# Altium schematic sheet Power_Section.SchDoc
size A4; DocumentNumber: 2; SheetNumber: 2; SheetTotal: 27
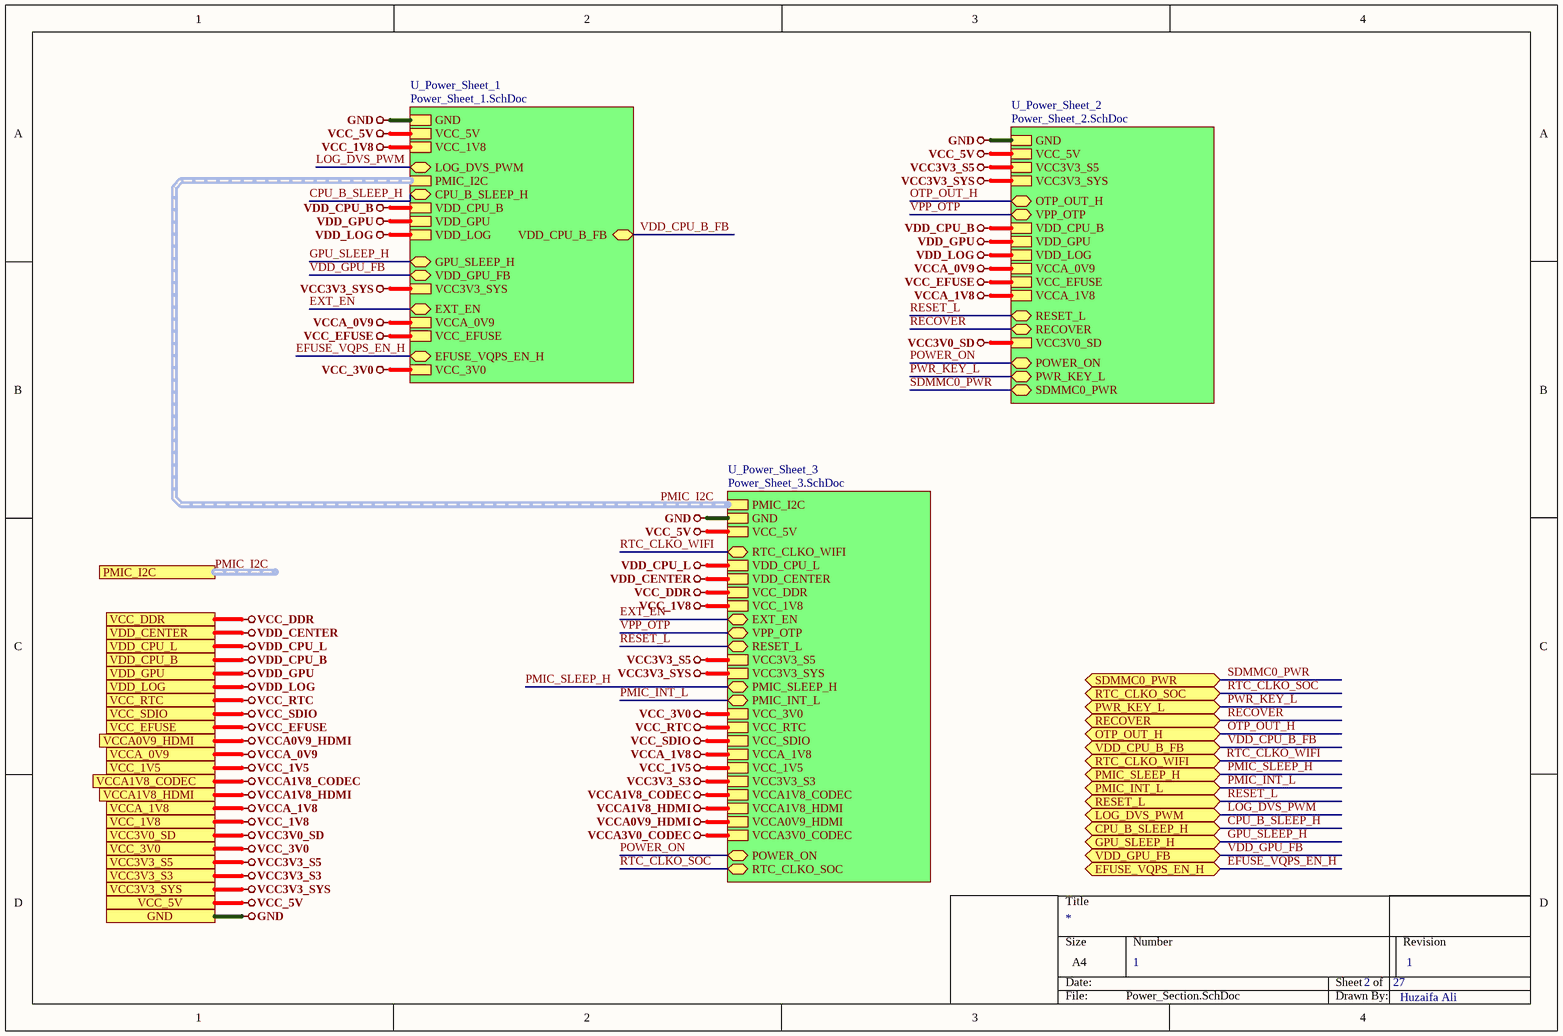
[diagram p0: Power_Section.SchDoc]

## Sub-sheets
U_Power_Sheet_1 = Power_Sheet_1.SchDoc: GND, VCC_5V, VCC_1V8, LOG_DVS_PWM (bidir), PMIC_I2C (harness PMIC_I2C), CPU_B_SLEEP_H (bidir), VDD_CPU_B, VDD_GPU, VDD_LOG, VDD_CPU_B_FB (bidir), GPU_SLEEP_H (bidir), VDD_GPU_FB (bidir), VCC3V3_SYS, EXT_EN (bidir), VCCA_0V9, VCC_EFUSE, EFUSE_VQPS_EN_H (bidir), VCC_3V0
U_Power_Sheet_2 = Power_Sheet_2.SchDoc: GND, VCC_5V, VCC3V3_S5, VCC3V3_SYS, OTP_OUT_H (bidir), VPP_OTP (bidir), VDD_CPU_B, VDD_GPU, VDD_LOG, VCCA_0V9, VCC_EFUSE, VCCA_1V8, RESET_L (bidir), RECOVER (bidir), VCC3V0_SD, POWER_ON (bidir), PWR_KEY_L (bidir), SDMMC0_PWR (bidir)
U_Power_Sheet_3 = Power_Sheet_3.SchDoc: PMIC_I2C (harness PMIC_I2C), GND, VCC_5V, RTC_CLKO_WIFI (bidir), VDD_CPU_L, VDD_CENTER, VCC_DDR, VCC_1V8, EXT_EN (bidir), VPP_OTP (bidir), RESET_L (bidir), VCC3V3_S5, VCC3V3_SYS, PMIC_SLEEP_H (bidir), PMIC_INT_L (bidir), VCC_3V0, VCC_RTC, VCC_SDIO, VCCA_1V8, VCC_1V5, VCC3V3_S3, VCCA1V8_CODEC, VCCA1V8_HDMI, VCCA0V9_HDMI, VCCA3V0_CODEC, POWER_ON (bidir), RTC_CLKO_SOC (bidir)

## Ports
CPU_B_SLEEP_H (bidir), EFUSE_VQPS_EN_H (bidir), GND, GPU_SLEEP_H (bidir), LOG_DVS_PWM (bidir), OTP_OUT_H (bidir), PMIC_I2C (harness PMIC_I2C), PMIC_INT_L (bidir), PMIC_SLEEP_H (bidir), PWR_KEY_L (bidir), RECOVER (bidir), RESET_L (bidir), RTC_CLKO_SOC (bidir), RTC_CLKO_WIFI (bidir), SDMMC0_PWR (bidir), VCC3V0_SD, VCC3V3_S3, VCC3V3_S5, VCC3V3_SYS, VCC_1V5, VCC_1V8, VCC_3V0, VCC_5V, VCC_DDR, VCC_EFUSE, VCC_RTC, VCC_SDIO, VCCA0V9_HDMI, VCCA1V8_CODEC, VCCA1V8_HDMI, VCCA_0V9, VCCA_1V8, VDD_CENTER, VDD_CPU_B, VDD_CPU_B_FB (bidir), VDD_CPU_L, VDD_GPU, VDD_GPU_FB (bidir), VDD_LOG

## Nets
GND: port GND, sheet U_Power_Sheet_1/GND, sheet U_Power_Sheet_3/GND, sheet U_Power_Sheet_2/GND
VCC3V0_SD: port VCC3V0_SD, sheet U_Power_Sheet_2/VCC3V0_SD
VCC3V3_S3: port VCC3V3_S3, sheet U_Power_Sheet_3/VCC3V3_S3
VCC3V3_S5: port VCC3V3_S5, sheet U_Power_Sheet_3/VCC3V3_S5, sheet U_Power_Sheet_2/VCC3V3_S5
VCC3V3_SYS: port VCC3V3_SYS, sheet U_Power_Sheet_1/VCC3V3_SYS, sheet U_Power_Sheet_3/VCC3V3_SYS, sheet U_Power_Sheet_2/VCC3V3_SYS
VCC_1V5: port VCC_1V5, sheet U_Power_Sheet_3/VCC_1V5
VCC_1V8: port VCC_1V8, sheet U_Power_Sheet_1/VCC_1V8, sheet U_Power_Sheet_3/VCC_1V8
VCC_3V0: port VCC_3V0, sheet U_Power_Sheet_1/VCC_3V0, sheet U_Power_Sheet_3/VCC_3V0
VCC_5V: port VCC_5V, sheet U_Power_Sheet_1/VCC_5V, sheet U_Power_Sheet_3/VCC_5V, sheet U_Power_Sheet_2/VCC_5V
VCC_DDR: port VCC_DDR, sheet U_Power_Sheet_3/VCC_DDR
VCC_EFUSE: port VCC_EFUSE, sheet U_Power_Sheet_1/VCC_EFUSE, sheet U_Power_Sheet_2/VCC_EFUSE
VCC_RTC: port VCC_RTC, sheet U_Power_Sheet_3/VCC_RTC
VCC_SDIO: port VCC_SDIO, sheet U_Power_Sheet_3/VCC_SDIO
VCCA0V9_HDMI: port VCCA0V9_HDMI, sheet U_Power_Sheet_3/VCCA0V9_HDMI
VCCA1V8_CODEC: port VCCA1V8_CODEC, sheet U_Power_Sheet_3/VCCA1V8_CODEC
VCCA1V8_HDMI: port VCCA1V8_HDMI, sheet U_Power_Sheet_3/VCCA1V8_HDMI
VCCA3V0_CODEC: sheet U_Power_Sheet_3/VCCA3V0_CODEC
VCCA_0V9: port VCCA_0V9, sheet U_Power_Sheet_1/VCCA_0V9, sheet U_Power_Sheet_2/VCCA_0V9
VCCA_1V8: port VCCA_1V8, sheet U_Power_Sheet_3/VCCA_1V8, sheet U_Power_Sheet_2/VCCA_1V8
VDD_CENTER: port VDD_CENTER, sheet U_Power_Sheet_3/VDD_CENTER
VDD_CPU_B: port VDD_CPU_B, sheet U_Power_Sheet_1/VDD_CPU_B, sheet U_Power_Sheet_2/VDD_CPU_B
VDD_CPU_L: port VDD_CPU_L, sheet U_Power_Sheet_3/VDD_CPU_L
VDD_GPU: port VDD_GPU, sheet U_Power_Sheet_1/VDD_GPU, sheet U_Power_Sheet_2/VDD_GPU
VDD_LOG: port VDD_LOG, sheet U_Power_Sheet_1/VDD_LOG, sheet U_Power_Sheet_2/VDD_LOG
CPU_B_SLEEP_H: port CPU_B_SLEEP_H, sheet U_Power_Sheet_1/CPU_B_SLEEP_H
EFUSE_VQPS_EN_H: port EFUSE_VQPS_EN_H, sheet U_Power_Sheet_1/EFUSE_VQPS_EN_H
EXT_EN: sheet U_Power_Sheet_1/EXT_EN, sheet U_Power_Sheet_3/EXT_EN
GPU_SLEEP_H: port GPU_SLEEP_H, sheet U_Power_Sheet_1/GPU_SLEEP_H
LOG_DVS_PWM: port LOG_DVS_PWM, sheet U_Power_Sheet_1/LOG_DVS_PWM
OTP_OUT_H: port OTP_OUT_H, sheet U_Power_Sheet_2/OTP_OUT_H
PMIC_INT_L: port PMIC_INT_L, sheet U_Power_Sheet_3/PMIC_INT_L
PMIC_SLEEP_H: port PMIC_SLEEP_H, sheet U_Power_Sheet_3/PMIC_SLEEP_H
POWER_ON: sheet U_Power_Sheet_3/POWER_ON, sheet U_Power_Sheet_2/POWER_ON
PWR_KEY_L: port PWR_KEY_L, sheet U_Power_Sheet_2/PWR_KEY_L
RECOVER: port RECOVER, sheet U_Power_Sheet_2/RECOVER
RESET_L: port RESET_L, sheet U_Power_Sheet_3/RESET_L, sheet U_Power_Sheet_2/RESET_L
RTC_CLKO_SOC: port RTC_CLKO_SOC, sheet U_Power_Sheet_3/RTC_CLKO_SOC
RTC_CLKO_WIFI: port RTC_CLKO_WIFI, sheet U_Power_Sheet_3/RTC_CLKO_WIFI
SDMMC0_PWR: port SDMMC0_PWR, sheet U_Power_Sheet_2/SDMMC0_PWR
VDD_CPU_B_FB: port VDD_CPU_B_FB, sheet U_Power_Sheet_1/VDD_CPU_B_FB
VDD_GPU_FB: port VDD_GPU_FB, sheet U_Power_Sheet_1/VDD_GPU_FB
VPP_OTP: sheet U_Power_Sheet_3/VPP_OTP, sheet U_Power_Sheet_2/VPP_OTP

## Buses and harness runs
harness PMIC_I2C = port PMIC_I2C
harness PMIC_I2C = sheet U_Power_Sheet_1/PMIC_I2C = sheet U_Power_Sheet_3/PMIC_I2C

## Notes on the sheet
- 1
- Huzaifa Ali